# Altium project tc264母版供电板.PrjPcb
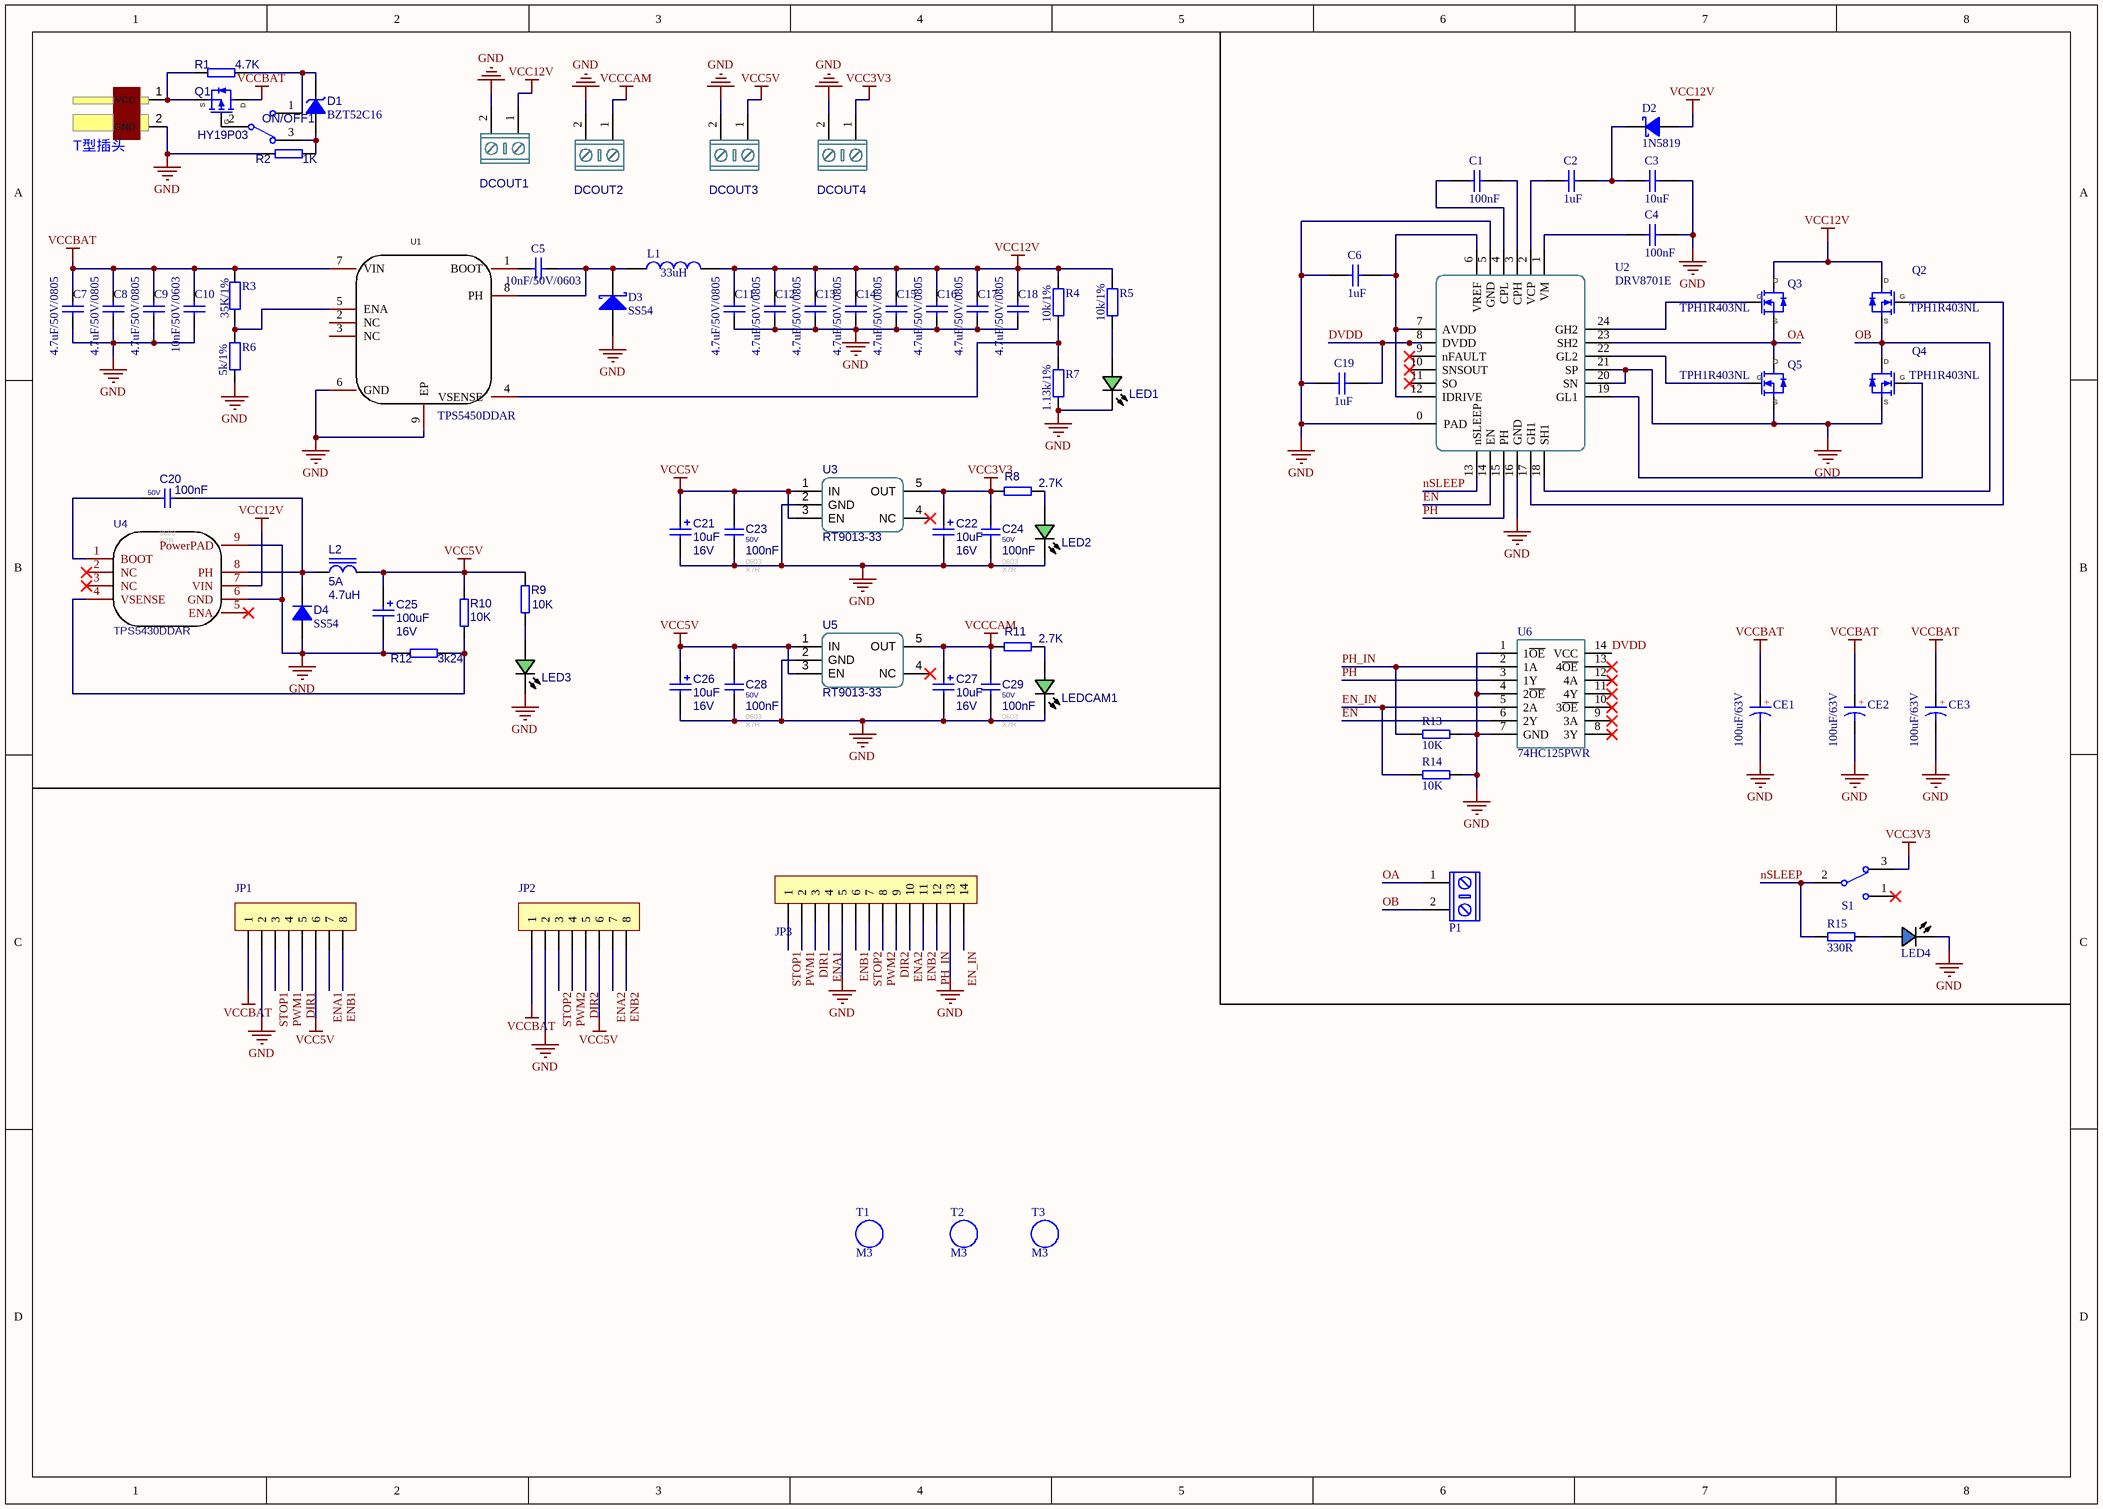
[diagram p0: tc264母版供电板.SchDoc]
1 sheet, 83 parts. Net scope: global (net labels, ports and power ports of the same name join across sheets).
Board files: tc264母版供电板.PcbDoc, PCB1.PcbDoc

## Sheet tc264母版供电板.SchDoc
size A3

### Parts
C1  value 100nF  [CAPC1608[0603]S-N]  (hidden comment: 100nF ±10% 50V)
C2  value 1uF  [CAPC1608[0603]S-N]  (hidden comment: 1uF ±10% 25V)
C3  value 10uF  [CAPC2012[0805]S-N]  (hidden comment: 10uF ±10% 25V)
C4  value 100nF  [CAPC1608[0603]S-N]  (hidden comment: 100nF ±10% 50V)
C5  10nF/50V/0603  [C0805_M]
C6  value 1uF  [CAPC1608[0603]S-N]  (hidden comment: 1uF ±10% 25V)
C7  4.7uF/50V/0805  [C0805_M]
C8  4.7uF/50V/0805  [C0805_M]
C9  4.7uF/50V/0805  [C0805_M]
C10  10nF/50V/0603  [C0805_M]
C11  4.7uF/50V/0805  [C0805_M]
C12  4.7uF/50V/0805  [C0805_M]
C13  4.7uF/50V/0805  [C0805_M]
C14  4.7uF/50V/0805  [C0805_M]
C15  4.7uF/50V/0805  [C0805_M]
C16  4.7uF/50V/0805  [C0805_M]
C17  4.7uF/50V/0805  [C0805_M]
C18  4.7uF/50V/0805  [C0805_M]
C19  value 1uF  [CAPC1608[0603]S-N]  (hidden comment: 1uF ±10% 25V)
C20  value 100nF  Voltage: 50V  Footprint: 0603  Type: X7R  [CAPC1608[0603]S-N]  (hidden comment: 100nF ±10% 50V)
C21  value 10uF  Voltage: 16V  [CAPT3216]  (hidden comment: 10uF 16V)
C22  value 10uF  Voltage: 16V  [CAPT3216]  (hidden comment: 10uF 16V)
C23  value 100nF  Voltage: 50V  Footprint: 0603  Type: X7R  [CAPC1608[0603]S-N]  (hidden comment: 100nF ±10% 50V)
C24  value 100nF  Voltage: 50V  Footprint: 0603  Type: X7R  [CAPC1608[0603]S-N]  (hidden comment: 100nF ±10% 50V)
C25  value 100uF  Voltage: 16V  [CAP-SMD_L7.3-W4.3-R-RD]  (hidden comment: 100uF 16V)
C26  value 10uF  Voltage: 16V  [CAPT3216]  (hidden comment: 10uF 16V)
C27  value 10uF  Voltage: 16V  [CAPT3216]  (hidden comment: 10uF 16V)
C28  value 100nF  Voltage: 50V  Footprint: 0603  Type: X7R  [CAPC1608[0603]S-N]  (hidden comment: 100nF ±10% 50V)
C29  value 100nF  Voltage: 50V  Footprint: 0603  Type: X7R  [CAPC1608[0603]S-N]  (hidden comment: 100nF ±10% 50V)
CE1  100uF/63V  [CE-3.5*8*11.5]
CE2  100uF/63V  [CE-3.5*8*11.5]
CE3  100uF/63V  [CE-3.5*8*11.5]
D1  BZT52C16  [SOD-123-L]
D2  1N5819  [SOD-123-L]
D3  SS54  [SMC]
D4  SS54  [SMA[DO-214AC]]
DCIN1  T型插头  [Wired T-Header ThroughHole]
DCOUT1  KF/WJ/DG 30x connecter  [KF/WJ/DG 301-2p-5.0mm]  (value not drawn)
DCOUT2  KF/WJ/DG 30x connecter  [KF/WJ/DG 301-2p-5.0mm]  (value not drawn)
DCOUT3  KF/WJ/DG 30x connecter  [KF/WJ/DG 301-2p-5.0mm]  (value not drawn)
DCOUT4  KF/WJ/DG 30x connecter  [KF/WJ/DG 301-2p-5.0mm]  (value not drawn)
JP1  HDR-1X8  [ZH1.5-WI-8P]  (value not drawn)
JP2  HDR-1X8  [ZH1.5-WI-8P]  (value not drawn)
JP3  HDR-1X14  [XH2.54-LI-14P]  (value not drawn)
L1  33uH  [L-SMD-0630]
L2  value 4.7uH  Imax: 5A  [0630 TPC 7*7*3]  (hidden comment: 4.7uH 5A)
LED1  翠绿贴片LED  [LEDC1608(0603)]  (value not drawn)
LED2  翠绿贴片LED  [LEDC1608(0603)]  (value not drawn)
LED3  翠绿贴片LED  [LEDC1608(0603)]  (value not drawn)
LED4  Blue  [LEDC1608(0603)]  (value not drawn)
LEDCAM1  翠绿贴片LED  [LEDC1608(0603)]  (value not drawn)
ON/OFF1  SW-SPDT  [SS12D10]  (value not drawn)
P1  KF/WJ/DG 30x connecter  [KF/WJ/DG 301-2p-5.0mm]  (value not drawn)
Q1  HY19P03  [TO-252AA]
Q2  TPH1R403NL  [DFN5x6]
Q3  TPH1R403NL  [DFN5x6]
Q4  TPH1R403NL  [DFN5x6]
Q5  TPH1R403NL  [DFN5x6]
R1  value 4.7K  [RESC1608[0603]S-N]  (hidden comment: 4.7K ±1%)
R2  value 1K  [RESC1608[0603]S-N]  (hidden comment: 1K ±1%)
R3  35K/1%  [R0805_L]
R4  10k/1%  [R0805_L]
R5  10k/1%  [R0805_L]
R6  5k/1%  [R0805_L]
R7  1.13k/1%  [R0805_L]
R8  value 2.7K  [RESC1608[0603]S-N]  (hidden comment: 2.7K ±1%)
R9  value 10K  [RESC1608[0603]S-N]  (hidden comment: 10K ±1%)
R10  value 10K  [RESC1608[0603]S-N]  (hidden comment: 10K ±1%)
R11  value 2.7K  [RESC1608[0603]S-N]  (hidden comment: 2.7K ±1%)
R12  value 3k24  [RESC1608[0603]S-N]  (hidden comment: 3k24 ±1%)
R13  value 10K  [RESC1608[0603]S-N]  (hidden comment: 10K ±1%)
R14  value 10K  [RESC1608[0603]S-N]  (hidden comment: 10K ±1%)
R15  value 330R  [RESC1608[0603]S-N]  (hidden comment: 330R ±1%)
S1  SW-SPDT  [SS12D10]  (value not drawn)
T1  M3  [M3 125X200]
T2  M3  [M3 125X200]
T3  M3  [M3 125X200]
U1  TPS5450DDAR  [SOP-8_L4.9-W3.9-P1.27-LS6.0-BL-EP]
U2  DRV8701E  [QFN24-4x4]
U3  RT9013-33  [SOT-23-5]
U4  TPS5430DDAR  [SOIC-8_L5.0-W4.0-P1.27-LS6.0-BL-EP2.0]
U5  RT9013-33  [SOT-23-5]
U6  74HC125PWR  [TSSOP-14]

### Nets
GND: C3.2 C4.2 C6.1 C7.1 C8.1 C9.1 C10.1 C11.1 C12.1 C13.1 C14.1 C15.1 C16.1 C17.1 C18.1 C19.1 C21.2 C22.2 C23.2 C24.2 C25.2 C26.2 C27.2 C28.2 C29.2 CE1.2 CE2.2 CE3.2 D3.1(A) D4.A DCIN1.2(GND) DCOUT1.2 DCOUT2.2 DCOUT3.2 DCOUT4.2 JP1.2 JP2.2 JP3.5 JP3.13 LED1.C LED2.C LED3.C LED4.C LEDCAM1.C Q4.3(S) Q5.3(S) R2.1 R6.1 R7.1 R12.2 R13.2 R14.2 U1.6(GND) U1.9(EP) U2.0(PAD) U2.5(GND) U2.16(GND) U2.20(SN) U2.21(SP) U3.2(GND) U4.6(GND) U4.9(PowerPAD) U5.2(GND) U6.1(1~{OE}) U6.4(2~{OE}) U6.7(GND)
VCC3V3: C22.1 C24.1 DCOUT4.1 R8.1 S1.3 U3.5(OUT)
VCC5V: C21.1 C23.1 C25.1 C26.1 C28.1 DCOUT3.1 JP1.6 JP2.6 L2.2 R9.2 R10.2 U3.1(IN) U3.3(EN) U5.1(IN) U5.3(EN)
VCC12V: C11.2 C12.2 C13.2 C14.2 C15.2 C16.2 C17.2 C18.2 D2.A DCOUT1.1 L1.2 Q2.1(D) Q3.1(D) R4.2 R5.2 U4.7(VIN)
VCCBAT: C7.2 C8.2 C9.2 C10.2 CE1.1 CE2.1 CE3.1 JP1.1 JP2.1 Q1.1(D) R3.2 U1.7(VIN)
VCCCAM: C27.1 C29.1 DCOUT2.1 R11.1 U5.5(OUT)
DIR1: JP1.5 JP3.3
DIR2: JP2.5 JP3.9
DVDD: C19.2 U2.8(DVDD) U6.14(VCC)
EN: U2.14(EN) U6.6(2Y)
EN_IN: JP3.14 R14.1 U6.5(2A)
ENA1: JP1.7 JP3.4
ENA2: JP2.7 JP3.10
ENB1: JP1.8 JP3.6
ENB2: JP2.8 JP3.11
nSLEEP: R15.1 S1.2 U2.13(nSLEEP)
OA: P1.1 Q3.3(S) Q5.1(D) U2.23(SH2)
OB: P1.2 Q2.3(S) Q4.1(D) U2.18(SH1)
PH: U2.15(PH) U6.3(1Y)
PH_IN: JP3.12 R13.1 U6.2(1A)
PWM1: JP1.4 JP3.2
PWM2: JP2.4 JP3.8
STOP1: JP1.3 JP3.1
STOP2: JP2.3 JP3.7
NetC1_1: C1.1 U2.4(CPL)
NetC1_2: C1.2 U2.3(CPH)
NetC2_1: C2.1 U2.2(VCP)
NetC2_2: C2.2 C3.1 D2.K
NetC4_1: C4.1 U2.1(VM)
NetC5_1: C5.1 D3.2(K) L1.1 U1.8(PH)
NetC5_2: C5.2 U1.1(BOOT)
NetC6_2: C6.2 U2.6(VREF) U2.7(AVDD) U2.12(IDRIVE)
NetC20_1: C20.1 U4.1(BOOT)
NetC20_2: C20.2 D4.K L2.1 U4.8(PH)
NetD1_A: D1.A ON/OFF1.3 R2.2
NetD1_K: D1.K ON/OFF1.1 R1.2
NetDCIN1_1: DCIN1.1(VCC) Q1.3(S) R1.1
NetLED1_A: LED1.A R5.1
NetLED2_A: LED2.A R8.2
NetLED3_A: LED3.A R9.1
NetLED4_A: LED4.A R15.2
NetLEDCAM1_A: LEDCAM1.A R11.2
NetON/OFF1_2: ON/OFF1.2 Q1.2(G)
NetQ2_2: Q2.2(G) U2.17(GH1)
NetQ3_2: Q3.2(G) U2.24(GH2)
NetQ4_2: Q4.2(G) U2.19(GL1)
NetQ5_2: Q5.2(G) U2.22(GL2)
NetR3_1: R3.1 R6.2 U1.5(ENA)
NetR4_1: R4.1 R7.2 U1.4(VSENSE)
NetR10_1: R10.1 R12.1 U4.4(VSENSE)

Not connected (* = marked no-connect by the designer): S1 1*; U1 2(NC) 3(NC); U2 9(nFAULT)* 10(SNSOUT)* 11(SO)*; U3 4(NC)*; U4 2(NC)* 3(NC)* 5(ENA)*; U5 4(NC)*; U6 8(3Y)* 9(3A)* 10(3~{OE})* 11(4Y)* 12(4A)* 13(4~{OE})*

### Notes on the sheet
- (in symbol CE) +

### Library data of the parts
C1 C4 = Cap-Chip_1: 贴片电容; Published: 8-Jun-2000; Revision: July-2002: Re-released for DXP Platform.; Publisher: Altium Limited; Price(RMB): 0.000; Voltage: 50V; Tolerance: ±10%
C2 C6 C19 = Cap-Chip_2: 贴片电容; Published: 8-Jun-2000; Revision: July-2002: Re-released for DXP Platform.; Publisher: Altium Limited; Price(RMB): 0.000; Voltage: 25V; Tolerance: ±10%
C3 C20 C23 C24 C28 C29 = Cap-Chip: 贴片电容; Tolerance: ±10%
  C3: Published: 8-Jun-2000; Revision: July-2002: Re-released for DXP Platform.; Publisher: Altium Limited; Price(RMB): 0.000; Voltage: 25V
  C20 C23 C24 C28 C29: Published: 2021-12-13; Revision: V1.2
C5 C7-C18 = C: 贴片电容/MLCC电容; BOM名称: 无极性贴片电容; 联系下单店铺卖家 免费帮你查找封装: 联系下单店铺卖家 免费技术支持
C21 C22 C25-C27 = Cap-Tan: Tantalum Capacitor; Published: 8-Jun-2000; Revision: July-2002: Re-released for DXP Platform.; Publisher: Altium Limited; Price(RMB): 0.000
CE1-CE3 = CE: 直插电解电容; 联系下单店铺卖家 免费帮你查找封装: 联系下单店铺卖家 免费技术支持; BOM名称: 直插电解电容
D1 = Diode TVS Uni-Dir: TRANSIENT VOLTAGE  SUPPRESSOR DIODE; Imax: 500mA; Published: 8-Jun-2000; Publisher: Altium Limited; Price(RMB): 0.000
D2 = Diode Schottky: 肖特基二极管 Diode; Imax: 500mA; Published: 8-Jun-2000; Revision: July-2002: Re-released for DXP Platform.; Publisher: Altium Limited; Price(RMB): 0.000; PartNumber: 1N5819
D3 = SS54: 肖特基二极管; 属性: 40V/5A; 以赠品形式获赠本封装库的买家，还可联系卖家免费指导AD软件使用: 封装库来自淘宝卖家ID：黄晶宝石; BOM名称: 肖特基二极管
D4 = Diode: 普通二极管 Diode; Imax: 500mA; Published: 8-Jun-2000; Revision: July-2002: Re-released for DXP Platform.; Publisher: Altium Limited; Price(RMB): 0.000
DCIN1 = T_Header
DCOUT1-DCOUT4 P1 = KF/WJ/DG 30x: 接线端子 2Pin
JP1 JP2 = Header 8: 8P接插件; 联系卖家，免费查找封装: 唯一出售店铺网址https://shop463601444.taobao.com; BOM名称: 8P接插件
JP3 = Header 14: 14P接插件; 联系卖家，免费查找封装: 唯一出售店铺网址https://shop463601444.taobao.com; 封装库来自淘宝卖家ID：黄晶宝石: 其他店铺购入均为盗版封装库，请立即申请退款，本店现金奖励50~200元; BOM名称: 14P接插件
L1 = L: 贴片小功率电感; BOM名称: 小功率贴片电感; 联系下单店铺卖家 免费帮你查找封装: 联系下单店铺卖家 免费技术支持
L2 = Ind-Power: 功率电感; DCR: .5m; Published: 8-Jun-2000; Revision: July-2002: Re-released for DXP Platform.; Publisher: Altium Limited; Price(RMB): 0.000
LED1-LED3 LEDCAM1 = LED Chip Green: Published: 8-Jun-2000; Revision: July-2002: Re-released for DXP Platform.; Publisher: Altium Limited; Price(RMB): 0.00
LED4 = LED Chip Blue: Typical Chip LED; Published: 8-Jun-2000; Revision: July-2002: Re-released for DXP Platform.; Publisher: Altium Limited; Price(RMB): 0.00; Color: Blue
ON/OFF1 S1 = SW-SPDT: 单刀双掷开关 3脚船型、钮子、拨动开关 SPDT Subminiature Toggle Switch; Published: 24-Mar-1999; Publisher: Altium Limited; Price(RMB): 0.000
Q1 = HY19P03: HY19P03 P-Channel MOSFET
Q2-Q5 = TPH1R403NL: 东芝 N沟 MOS
R1 = Res-Chip_4: 贴片电阻; Published: 8-Jun-2000; Revision: July-2002: Re-released for DXP Platform.; Tolerance: ±1%
R2 R15 = Res-Chip_3: 贴片电阻; Published: 8-Jun-2000; Revision: July-2002: Re-released for DXP Platform.; Tolerance: ±1%
  R15: Publisher: Altium Limited; Price(RMB): 0.000
R3-R7 = R: 贴片电阻; 联系下单店铺卖家 免费帮你查找封装: 联系下单店铺卖家 免费技术支持; BOM名称: 贴片电阻
R8 R11 = Res-Chip_2: 贴片电阻; Published: 8-Jun-2000; Revision: July-2002: Re-released for DXP Platform.; Tolerance: ±1%
R9 R10 R12 = Res-Chip: 贴片电阻; Published: 8-Jun-2000; Revision: July-2002: Re-released for DXP Platform.; Tolerance: ±1%
R13 R14 = Res-Chip_1: 贴片电阻; Published: 8-Jun-2000; Revision: July-2002: Re-released for DXP Platform.; Publisher: Altium Limited; Price(RMB): 0.000; Tolerance: ±1%
T1-T3 = M3: 铜柱孔; 联系卖家，免费查找封装: 唯一出售店铺网址https://shop463601444.taobao.com; 封装库来自淘宝卖家：黄晶宝石: 其他店铺购入均为盗版封装库，请立即申请退款，本店现金奖励200~1000元; BOM名称: 铜柱孔
U1 = TPS5450DDAR: Manufacturer: TI(德州仪器); Add into BOM: yes; Function: 降压型; Name: TPS5450DDAR; Symbol: TPS5450DDAR; Device: TPS5450DDAR; LCSC Part Name: TPS5450DDAR; Supplier Part: C114425; Manufacturer Part: TPS5450DDAR; Supplier Footprint: SOP-8_EP_150mil; JLCPCB Part Class: Extended Part; Datasheet: https://atta.szlcsc.com/upload/public/pdf/source/20170620/1497944765773.pdf; Supplier: LCSC; Convert to PCB: yes; Synchronous Rectification: -; Number of Outputs: -; Topology: -; Input Voltage: -; Switching Frequency: -; Output Current (Max): -
U2 = DRV8701E: DRV8701E Ti全桥驱动芯片
U3 U5 = RT9013-33: 3.3V 500mA SOT-23-5 LDO
U4 = TPS5430DDAR: BOM_Manufacturer: TI; BOM_Supplier: LCSC; BOM_Manufacturer Part: TPS5430DDAR; BOM_Supplier Part: C9864; BOM_JLCPCB Part Class: Basic Part; spicePre: U; spiceSymbolName: TPS5430DDAR
U6 = SN74HC125PWR: 三态输出的四路缓冲器 TSSOP-20